# Altium schematic sheet Top-Sheet.SchDoc
size A4; DocumentNumber: 1; SheetNumber: 1
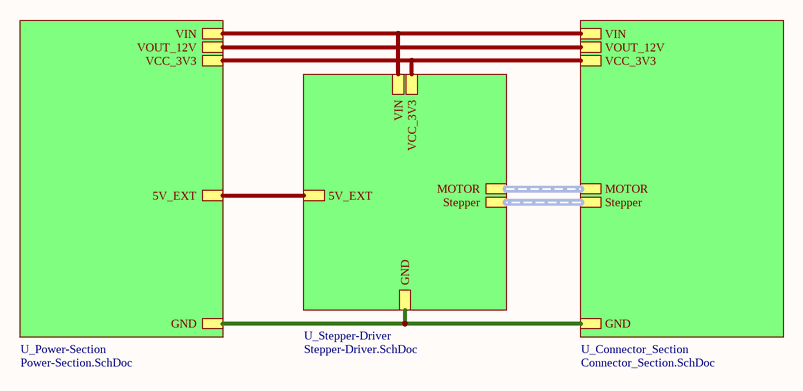
[diagram p0: Top-Sheet.SchDoc]

## Sub-sheets
U_Connector_Section = Connector_Section.SchDoc: GND, VCC_3V3, VOUT_12V, VIN, MOTOR (harness MOTOR), Stepper (harness Stepper)
U_Power-Section = Power-Section.SchDoc: VOUT_12V, VIN, GND, 5V_EXT, VCC_3V3
U_Stepper-Driver = Stepper-Driver.SchDoc: Stepper (harness Stepper), MOTOR (harness MOTOR), GND, VIN, 5V_EXT, VCC_3V3

## Nets
(unnamed): sheet U_Power-Section/VOUT_12V, sheet U_Connector_Section/VOUT_12V
(unnamed): sheet U_Power-Section/VIN, sheet U_Connector_Section/VIN, sheet U_Stepper-Driver/VIN
(unnamed): sheet U_Power-Section/GND, sheet U_Connector_Section/GND, sheet U_Stepper-Driver/GND
(unnamed): sheet U_Power-Section/5V_EXT, sheet U_Stepper-Driver/5V_EXT
(unnamed): sheet U_Power-Section/VCC_3V3, sheet U_Connector_Section/VCC_3V3, sheet U_Stepper-Driver/VCC_3V3

## Buses and harness runs
harness sheet U_Connector_Section/MOTOR = sheet U_Stepper-Driver/MOTOR
harness sheet U_Connector_Section/Stepper = sheet U_Stepper-Driver/Stepper